# Altium schematic sheet MONO65_DB_A1_s02 [Block diagram].SchDoc
size A3; DocumentNumber: 2; SheetNumber: 2; SheetTotal: 3
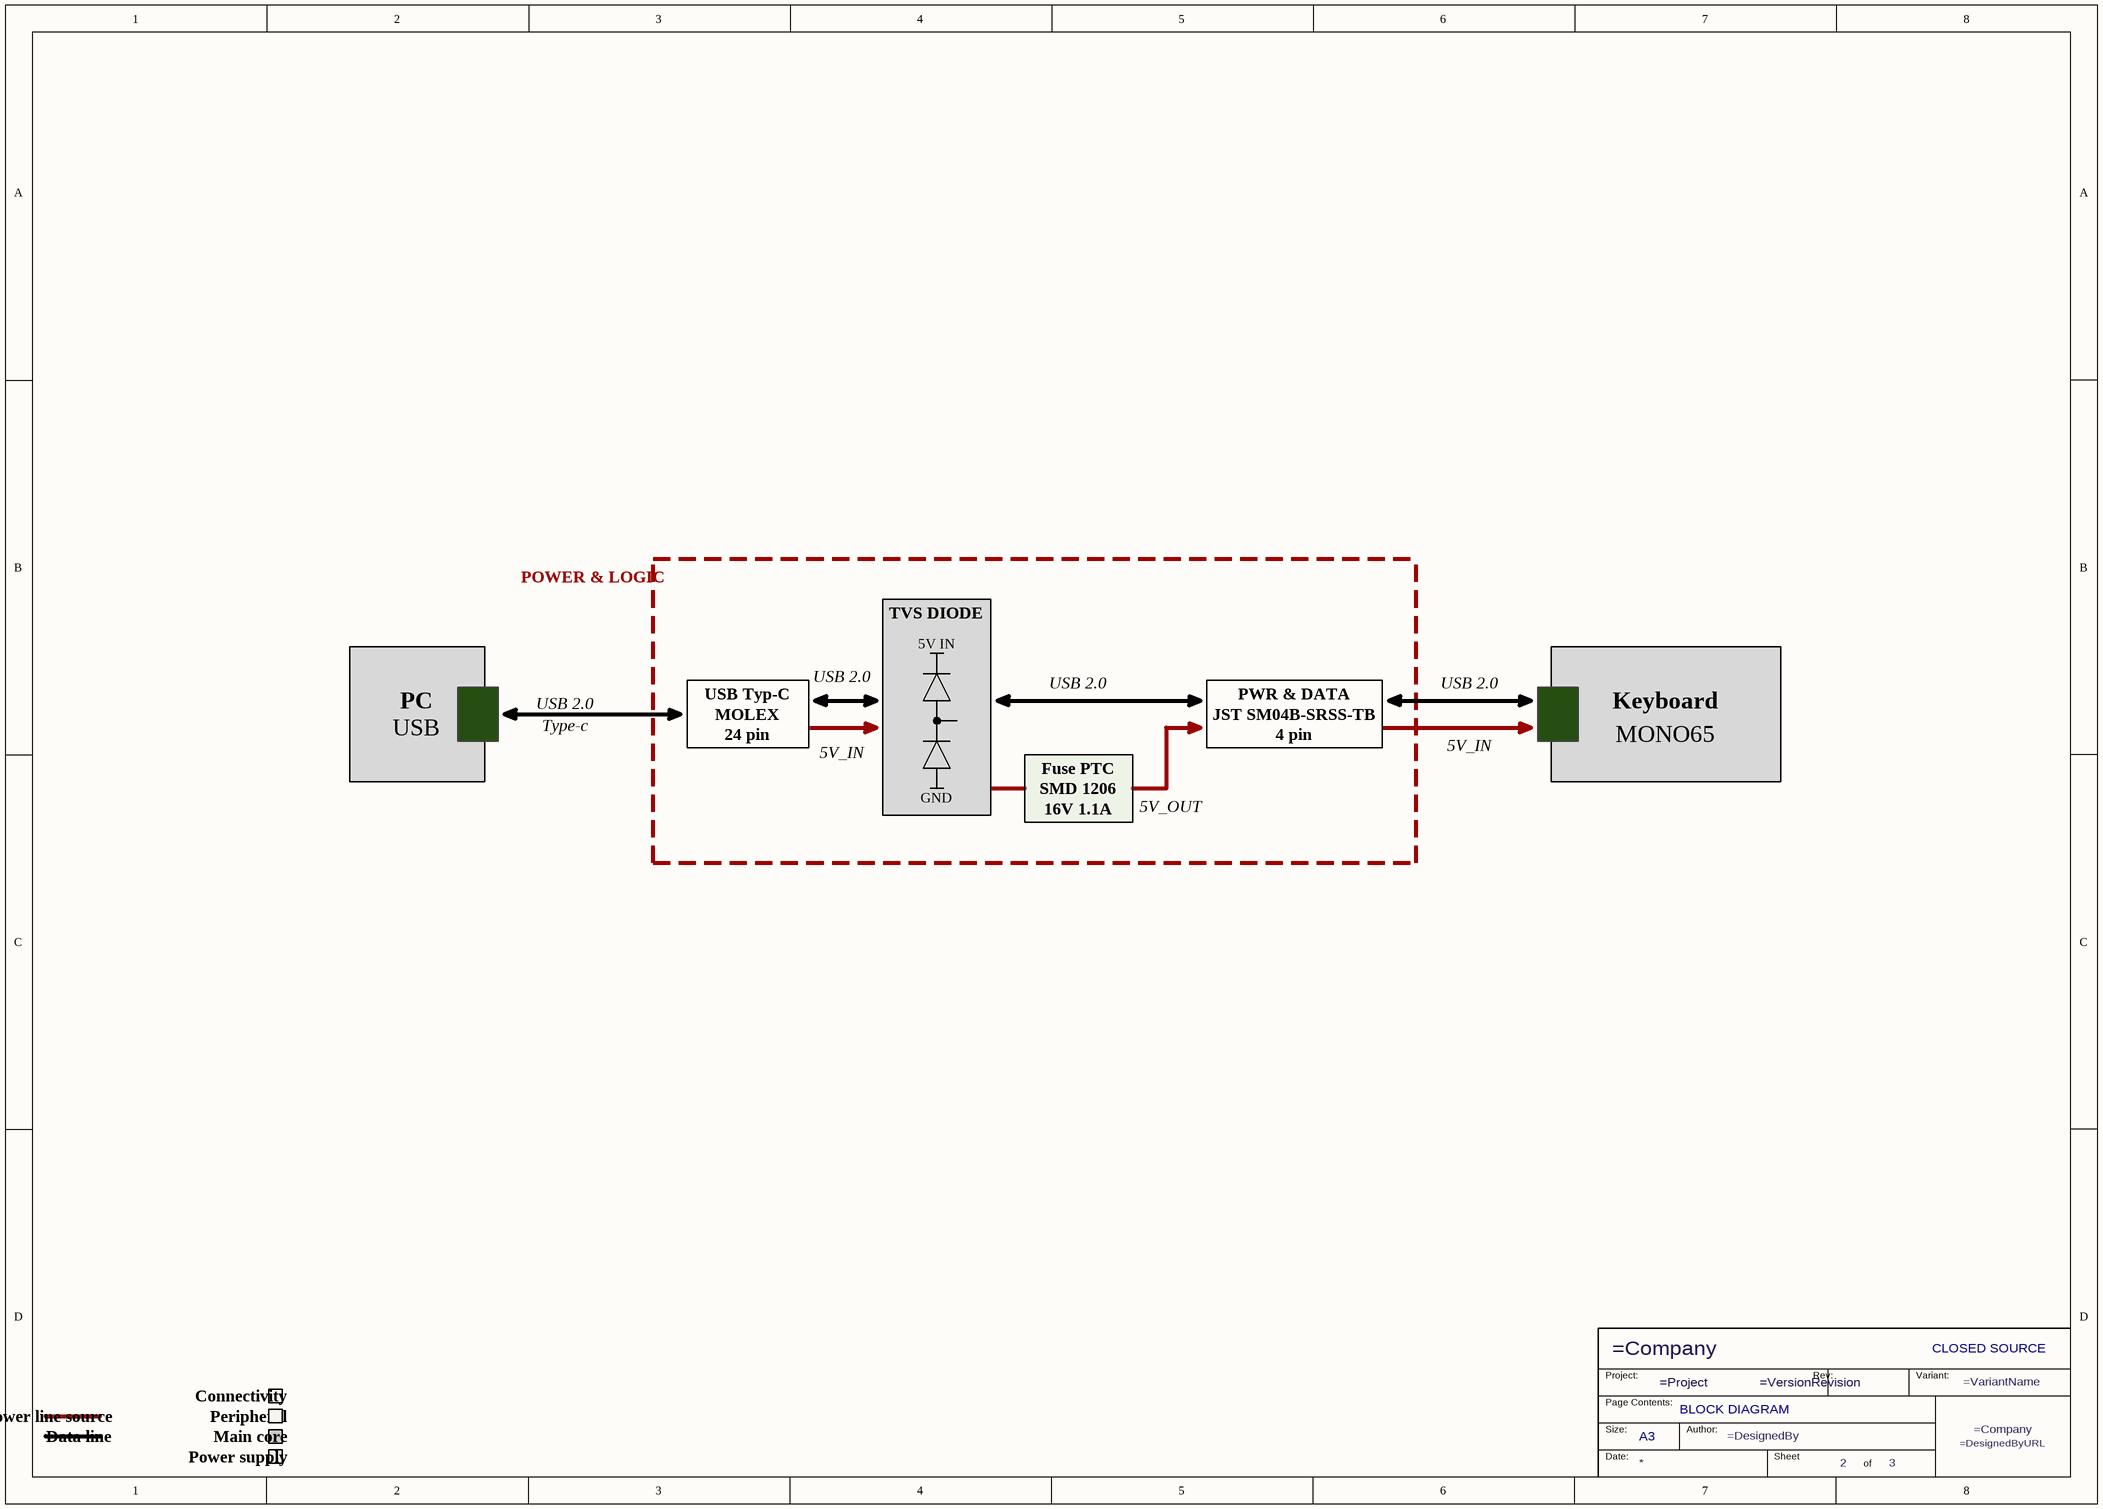
[diagram p0: MONO65_DB_A1_s02 [Block diagram].SchDoc]

## Parts
TB*?  PageContents: BLOCK DIAGRAM  Licence: CLOSED SOURCE  Size: A3  (hidden comment: TBL TitleBlock 01)  (graphical)

## Notes on the sheet
- POWER & LOGIC
- TVS DIODE
- 5V IN
- PC
- USB
- USB 2.0
- Type-c
- MOLEX
- USB Typ-C
- JST SM04B-SRSS-TB
- PWR & DATA
- Keyboard
- 24 pin
- 5V_IN
- GND
- Fuse PTC
- SMD 1206
- 4 pin
- MONO65
- 16V 1.1A
- 5V_OUT
- Connectivity
- Data line
- Power line source
- Peripheral
- Main core
- Power supply
- (in symbol TBL TitleBlock 01) Project:; Rev:; Variant:; Page Contents:; Size:; Author:; Date:; Sheet; of

## Library data of the parts
TB*? = TBL TitleBlock 01: Custom Title block